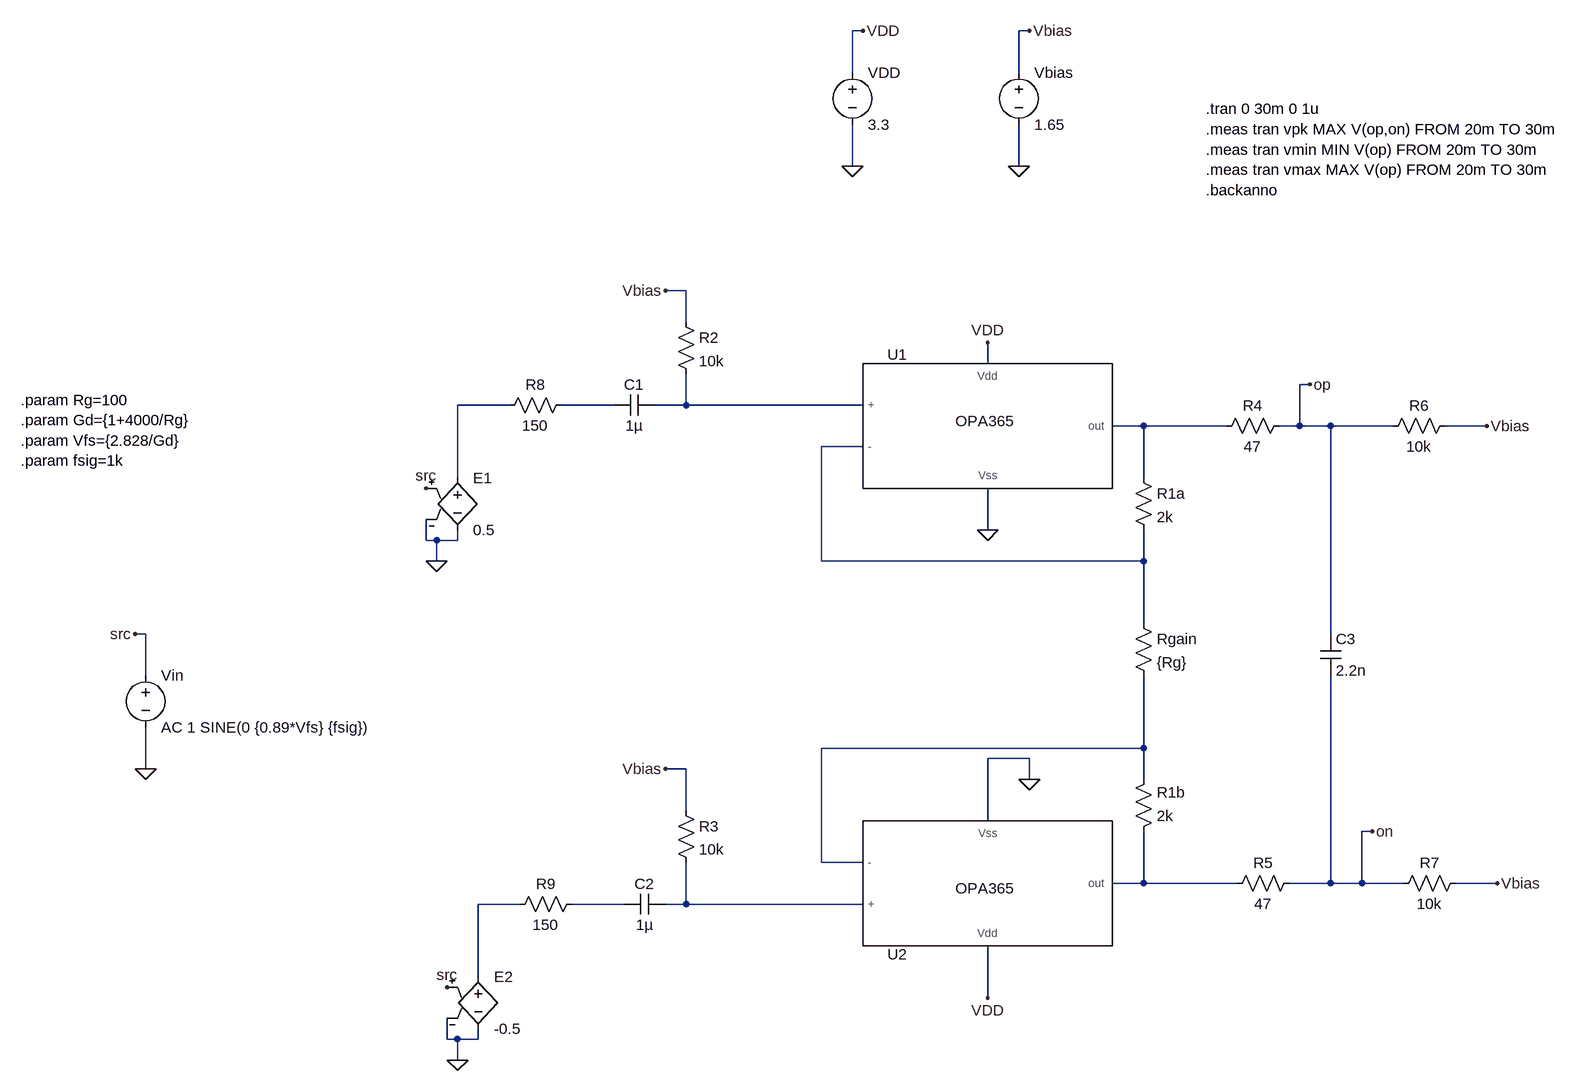
[diagram p0: schematic preamp.asc]
preamp.asc, the LTspice schematic file:
Version 4.1
SHEET 1 1468 1108
WIRE -80 -528 -96 -528
WIRE 176 -528 160 -528
WIRE -96 -464 -96 -528
WIRE 160 -464 160 -528
WIRE -96 -320 -96 -384
WIRE 160 -320 160 -384
WIRE -352 -128 -384 -128
WIRE -352 -80 -352 -128
WIRE 112 -16 112 -48
WIRE 608 16 592 16
WIRE -624 48 -704 48
WIRE -464 48 -544 48
WIRE -352 48 -352 0
WIRE -352 48 -400 48
WIRE -80 48 -352 48
WIRE 352 80 304 80
WIRE 480 80 352 80
WIRE 592 80 592 16
WIRE 592 80 560 80
WIRE 640 80 592 80
WIRE 736 80 640 80
WIRE 880 80 816 80
WIRE -80 112 -144 112
WIRE -704 160 -704 48
WIRE 352 160 352 80
WIRE 112 240 112 176
WIRE -752 256 -752 224
WIRE -736 256 -752 256
WIRE -704 256 -704 240
WIRE -704 256 -736 256
WIRE -736 288 -736 256
WIRE -144 288 -144 112
WIRE 352 288 352 240
WIRE 352 288 -144 288
WIRE 352 384 352 288
WIRE -1184 400 -1200 400
WIRE 640 400 640 80
WIRE -1184 464 -1184 400
WIRE 352 576 352 464
WIRE 352 576 -144 576
WIRE 176 592 112 592
WIRE -1184 608 -1184 544
WIRE -352 608 -384 608
WIRE 176 624 176 592
WIRE 352 624 352 576
WIRE -352 672 -352 608
WIRE 112 688 112 592
WIRE 704 704 688 704
WIRE -144 752 -144 576
WIRE -80 752 -144 752
WIRE 352 784 352 704
WIRE 352 784 304 784
WIRE 496 784 352 784
WIRE 640 784 640 464
WIRE 640 784 576 784
WIRE 688 784 688 704
WIRE 688 784 640 784
WIRE 752 784 688 784
WIRE 896 784 832 784
WIRE -608 816 -672 816
WIRE -448 816 -528 816
WIRE -352 816 -352 752
WIRE -352 816 -384 816
WIRE -80 816 -352 816
WIRE -672 928 -672 816
WIRE 112 960 112 880
WIRE -720 1024 -720 992
WIRE -704 1024 -720 1024
WIRE -672 1024 -672 1008
WIRE -672 1024 -704 1024
WIRE -704 1056 -704 1024
FLAG -384 -128 Vbias
FLAG -384 608 Vbias
FLAG 160 -320 0
FLAG -96 -320 0
FLAG 176 -528 Vbias
FLAG -80 -528 VDD
FLAG 112 -48 VDD
FLAG 112 960 VDD
FLAG 176 624 0
FLAG 112 240 0
FLAG 880 80 Vbias
FLAG 896 784 Vbias
FLAG -1184 608 0
FLAG -1200 400 src
FLAG -752 176 src
FLAG -720 944 src
FLAG -704 1056 0
FLAG -736 288 0
FLAG 608 16 op
FLAG 704 704 on
SYMBOL res 336 144 R0
SYMATTR InstName R1a
SYMATTR Value 2k
SYMBOL res 336 720 M180
WINDOW 0 36 76 Left 2
WINDOW 3 36 40 Left 2
SYMATTR InstName R1b
SYMATTR Value 2k
SYMBOL res 336 368 R0
SYMATTR InstName Rgain
SYMATTR Value {Rg}
SYMBOL cap -400 32 R90
WINDOW 0 0 32 VBottom 2
WINDOW 3 32 32 VTop 2
SYMATTR InstName C1
SYMATTR Value 1µ
SYMBOL cap -384 800 R90
WINDOW 0 0 32 VBottom 2
WINDOW 3 32 32 VTop 2
SYMATTR InstName C2
SYMATTR Value 1µ
SYMBOL res -368 -96 R0
SYMATTR InstName R2
SYMATTR Value 10k
SYMBOL res -368 656 R0
SYMATTR InstName R3
SYMATTR Value 10k
SYMBOL res 592 768 R90
WINDOW 0 0 56 VBottom 2
WINDOW 3 32 56 VTop 2
SYMATTR InstName R5
SYMATTR Value 47
SYMBOL res 576 64 R90
WINDOW 0 0 56 VBottom 2
WINDOW 3 32 56 VTop 2
SYMATTR InstName R4
SYMATTR Value 47
SYMBOL cap 624 400 R0
SYMATTR InstName C3
SYMATTR Value 2.2n
SYMBOL voltage -96 -480 R0
SYMATTR InstName VDD
SYMATTR Value 3.3
SYMBOL voltage 160 -480 R0
SYMATTR InstName Vbias
SYMATTR Value 1.65
SYMBOL res 832 64 R90
WINDOW 0 0 56 VBottom 2
WINDOW 3 32 56 VTop 2
SYMATTR InstName R6
SYMATTR Value 10k
SYMBOL res 848 768 R90
WINDOW 0 0 56 VBottom 2
WINDOW 3 32 56 VTop 2
SYMATTR InstName R7
SYMATTR Value 10k
SYMBOL voltage -1184 448 R0
SYMATTR InstName Vin
SYMATTR Value AC 1 SINE(0 {0.89*Vfs} {fsig})
SYMBOL e -704 144 R0
SYMATTR InstName E1
SYMATTR Value 0.5
SYMBOL e -672 912 R0
SYMATTR InstName E2
SYMATTR Value -0.5
SYMBOL res -512 800 R90
WINDOW 0 0 56 VBottom 2
WINDOW 3 32 56 VTop 2
SYMATTR InstName R9
SYMATTR Value 150
SYMBOL res -528 32 R90
WINDOW 0 0 56 VBottom 2
WINDOW 3 32 56 VTop 2
SYMATTR InstName R8
SYMATTR Value 150
SYMBOL OPA365 112 80 R0
SYMATTR InstName U1
SYMBOL OPA365 112 784 M180
SYMATTR InstName U2
TEXT -1376 40 Left 2 !.param Rg=100\n.param Gd={1+4000/Rg}\n.param Vfs={2.828/Gd}\n.param fsig=1k
TEXT 448 -408 Left 2 !.tran 0 30m 0 1u\n.meas tran vpk MAX V(op,on) FROM 20m TO 30m\n.meas tran vmin MIN V(op) FROM 20m TO 30m\n.meas tran vmax MAX V(op) FROM 20m TO 30m\n.backanno

The netlist it stands for:
* preamp.asc
R1a N004 N005 2k
R1b N007 N006 2k
Rgain N005 N006 {Rg}
C1 N003 N002 1µ
C2 N010 N009 1µ
R2 Vbias N003 10k
R3 Vbias N010 10k
R5 on N007 47
R4 op N004 47
C3 op on 2.2n
VDD VDD 0 3.3
Vbias Vbias 0 1.65
R6 Vbias op 10k
R7 Vbias on 10k
Vin src 0 AC 1 SINE(0 {0.89*Vfs} {fsig})
E1 N001 0 src 0 0.5
E2 N008 0 src 0 -0.5
R9 N009 N008 150
R8 N002 N001 150
X§U1 N003 N005 VDD 0 N004 OPA365  ; pins + - Vdd Vss out
X§U2 N010 N006 VDD 0 N007 OPA365  ; pins + - Vdd Vss out
.param Rg=100
.param Gd={1+4000/Rg}
.param Vfs={2.828/Gd}
.param fsig=1k
.tran 0 30m 0 1u
.meas tran vpk MAX V(op,on) FROM 20m TO 30m
.meas tran vmin MIN V(op) FROM 20m TO 30m
.meas tran vmax MAX V(op) FROM 20m TO 30m
.backanno
.lib OPA365.lib
.backanno
.end